# Altium schematic sheet text_frames.SchDoc
size 254 x 203 mm
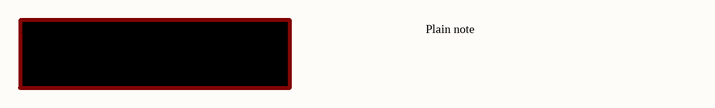
[diagram p0: text_frames.SchDoc]

## Notes on the sheet
- Boxed note
- Plain note